# Altium schematic sheet AMP2.SchDoc
size A; SheetNumber: 7; SheetTotal: 8
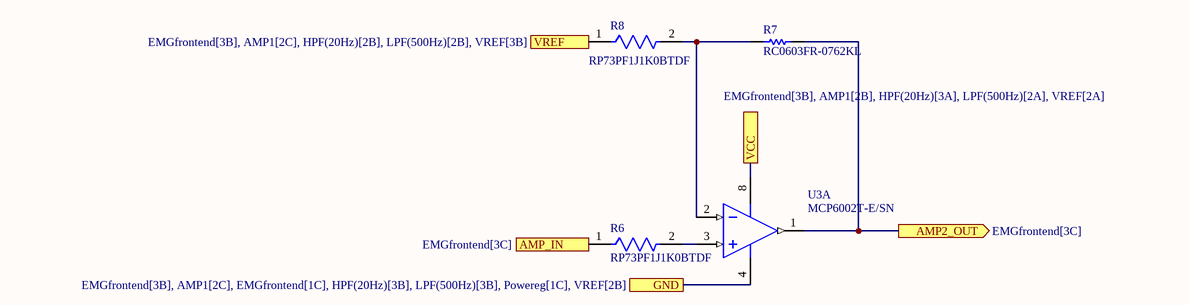
[diagram p0: AMP2.SchDoc]

## Parts
R6  RP73PF1J1K0BTDF  [FP-RP73P-1J-MFG]
R7  RC0603FR-0762KL  [RESC1608X55X25NL10T15]
R8  RP73PF1J1K0BTDF  [FP-RP73P-1J-MFG]
U3  MCP6002T-E/SN  [SOIC-SN8_N]  (part A of 2)

## Ports
AMP2_OUT (out, see EMGfrontend[3C]), AMP_IN (in, see EMGfrontend[3C]), GND (see EMGfrontend[3B], AMP1[2C], EMGfrontend[1C], HPF(20Hz)[3B], LPF(500Hz)[3B], Powereg[1C], VREF[2B]), VCC (see EMGfrontend[3B], AMP1[2B], HPF(20Hz)[3A], LPF(500Hz)[2A], VREF[2A]), VREF (in, see EMGfrontend[3B], AMP1[2C], HPF(20Hz)[2B], LPF(500Hz)[2B], VREF[3B])

## Nets
AMP2_OUT: R7.2 U3.1(VOUTA) ; port AMP2_OUT
AMP_IN: R6.1 ; port AMP_IN
GND: U3.4(VSS) ; port GND
VCC: U3.8(VDD) ; port VCC
VREF: R8.1 ; port VREF
NetR6_2: R6.2 U3.3(VINA+)
NetR7_1: R7.1 R8.2 U3.2(VINA-)

## Library data of the parts
R6 R8 = CMP-03211-004517-1: RES SMD 1K OHM 0.1% 1/6W 0603; Manufacturer: TE Connectivity; Value: 1KΩ; Power Rating: 0.166W; Tolerance: 0.001; Temperature Coefficient: 25ppm/°C; Voltage Rating: 100V; Composition: Thin Film; Category: Res; Temperature Range High: +155°C; Device Class L1: Passive Components; Digikey Description: RES SMD 1K OHM 0.1% 1/6W 0603; Lead Free: Yes; RoHS: TRUE; Ipc Land Pattern Name: RESC15580X45; Automotive: No; Temperature: -55°C to +155°C; Height: 0.55mm; ComponentLink2URL: https://www.te.com/commerce/DocumentDelivery/DDEController?Action=srchrtrv&DocNm=1773272&DocType=DS&DocLang=English; Manufacturer Part Number: RP73PF1J1K0BTDF; Resistance: 1KΩ; ComponentLink2Description: Datasheet; Temperature Range Low: -55°C; Octopart: https://octopart.com/rp73pf1j1k0btdf-te+connectivity-45465729; Device Class L3: Chip SMD Resistors; Series: RP73P; Package: RP73P-1J; Device Class L2: Resistors
R7 = CMP-2000-04104-1: Manufacturer: Yageo; Part Number: RC0603FR-0762KL
U3 = CMP-0187-00363-3: None; Nominal Supply Current: 100uA; Operating Supply Voltage: 5.5V; Input Bias Current: 1pA; Output Current per Channel: 23mA; Unity Gain Bandwidth Product: 1MHz; Number of Elements: 2; Power Supply Rejection Ratio (PSRR): 86dB; Slew Rate: 0.6V/µs; Min Supply Voltage: 1.8V; Voltage Gain: 112dB; Max Supply Voltage: 6V; Input Offset Voltage (Vos): 4.5mV; Common Mode Rejection Ratio: 60dB; Amplifier Type: GENERAL PURPOSE; Technology: CMOS; Output Current: 23mA; Number of Pins: 8; Lead Free: Lead Free; Number of Channels: 2; Package Quantity: 3300; Max Operating Temperature: 125°C; Number of Circuits: 2; Supply Current: 100uA; Gain Bandwidth Product: 1MHz; Min Operating Temperature: -40°C; Series: -; Mount: Surface Mount; Case/Package: SOIC; Radiation Hardening: No; Packaging: Tape and Reel; Operating Supply Current: 100uA; RoHS Compliant: Yes